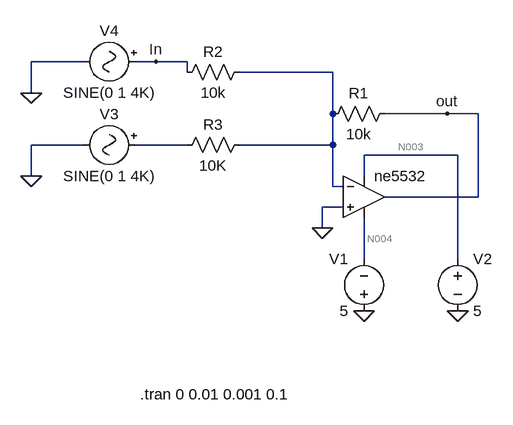
[diagram p0: schematic Sumup schakeling.asc]
Sumup schakeling.asc, the LTspice schematic file:
Version 4.1
SHEET 1 880 680
WIRE -176 -272 -256 -272
WIRE -64 -272 -96 -272
WIRE -16 -272 -64 -272
WIRE -16 -256 -16 -272
WIRE 208 -256 64 -256
WIRE -256 -224 -256 -272
WIRE 208 -192 208 -256
WIRE 384 -192 288 -192
WIRE 432 -192 384 -192
WIRE -176 -144 -256 -144
WIRE -16 -144 -96 -144
WIRE 208 -144 208 -192
WIRE 208 -144 64 -144
WIRE 400 -128 256 -128
WIRE -256 -96 -256 -144
WIRE 256 -96 256 -128
WIRE 208 -80 208 -144
WIRE 224 -80 208 -80
WIRE 432 -64 432 -192
WIRE 432 -64 288 -64
WIRE 224 -48 192 -48
WIRE 192 -16 192 -48
WIRE 256 32 256 -32
WIRE 400 32 400 -128
FLAG 192 -16 0
FLAG 256 112 0
FLAG 400 112 0
FLAG -256 -96 0
FLAG -256 -224 0
FLAG -64 -272 In
FLAG 384 -192 out
SYMBOL voltage 256 128 R180
WINDOW 0 24 96 Left 2
WINDOW 3 24 16 Left 2
SYMATTR InstName V1
SYMATTR Value 5
SYMBOL voltage 400 16 R0
SYMATTR InstName V2
SYMATTR Value 5
SYMBOL res 304 -208 R90
WINDOW 0 0 56 VBottom 2
WINDOW 3 32 56 VTop 2
SYMATTR InstName R1
SYMATTR Value 10k
SYMBOL res 80 -272 R90
WINDOW 0 0 56 VBottom 2
WINDOW 3 32 56 VTop 2
SYMATTR InstName R2
SYMATTR Value 10k
SYMBOL res 80 -160 R90
WINDOW 0 0 56 VBottom 2
WINDOW 3 32 56 VTop 2
SYMATTR InstName R3
SYMATTR Value 10K
SYMBOL Misc\\signal -80 -144 R90
WINDOW 0 -32 56 VBottom 2
WINDOW 3 32 56 VTop 2
SYMATTR InstName V3
SYMATTR Value SINE(0 1 4K)
SYMBOL Misc\\signal -80 -272 R90
WINDOW 0 -32 56 VBottom 2
WINDOW 3 32 56 VTop 2
SYMATTR InstName V4
SYMATTR Value SINE(0 1 4K)
SYMBOL OpAmps\\UniversalOpAmp2 256 -64 R0
SYMATTR InstName ne5532
SYMATTR Value2 Avol=100K GBW=10Meg Slew=9Meg
SYMATTR SpiceLine Ilimit=38m Rail=2 Vos=0
SYMATTR SpiceLine2 En=0 Enk=0 In=0 Ink=0 Rin=300K
TEXT -88 240 Left 2 !.tran 0 0.01 0.001 0.1

The netlist it stands for:
* Sumup schakeling.asc
V1 0 N004 5
V2 N003 0 5
R1 out N001 10k
R2 N001 In 10k
R3 N001 N002 10K
V3 N002 0 SINE(0 1 4K)
V4 In 0 SINE(0 1 4K)
X§ne5532 0 N001 N003 N004 out level2 Avol=100K GBW=10Meg Slew=9Meg Ilimit=38m Rail=2 Vos=0 En=0 Enk=0 In=0 Ink=0 Rin=300K  ; pins In+ In- V+ V- OUT
.tran 0 0.01 0.001 0.1
.lib UniversalOpAmp2.lib
.backanno
.end

* Results of the author's LTspice run, read from the files saved beside the schematic
* Operating Point, zero values left out:
*   V(n003) = 5 V
*   V(n004) = -5 V
*   I(V1) = -306.7 µA
*   I(V2) = -306.7 µA
*   Ix(ne5532:3) = 306.7 µA
*   Ix(ne5532:4) = -306.7 µA
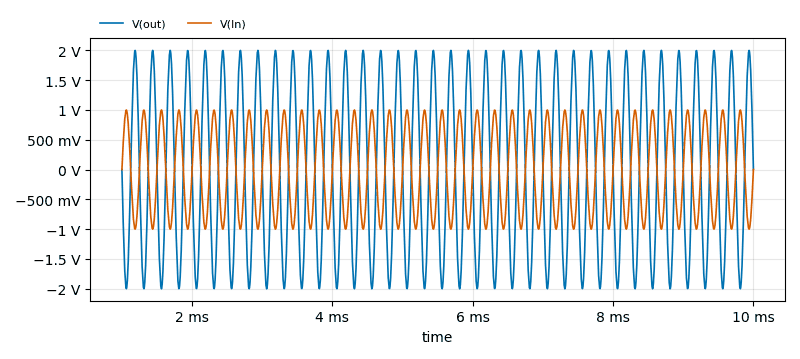
[diagram p1: Transient Analysis of Sumup schakeling.asc, plotted from the saved traces]
* Transient Analysis, 1 run:
*   V(out): min -2 V, max 2 V, average -69.87 µV, rms 1.438 V, last 2.522 mV
*   V(In): min -1 V, max 1 V, average 34.94 µV, rms 719.2 mV, last 0 V